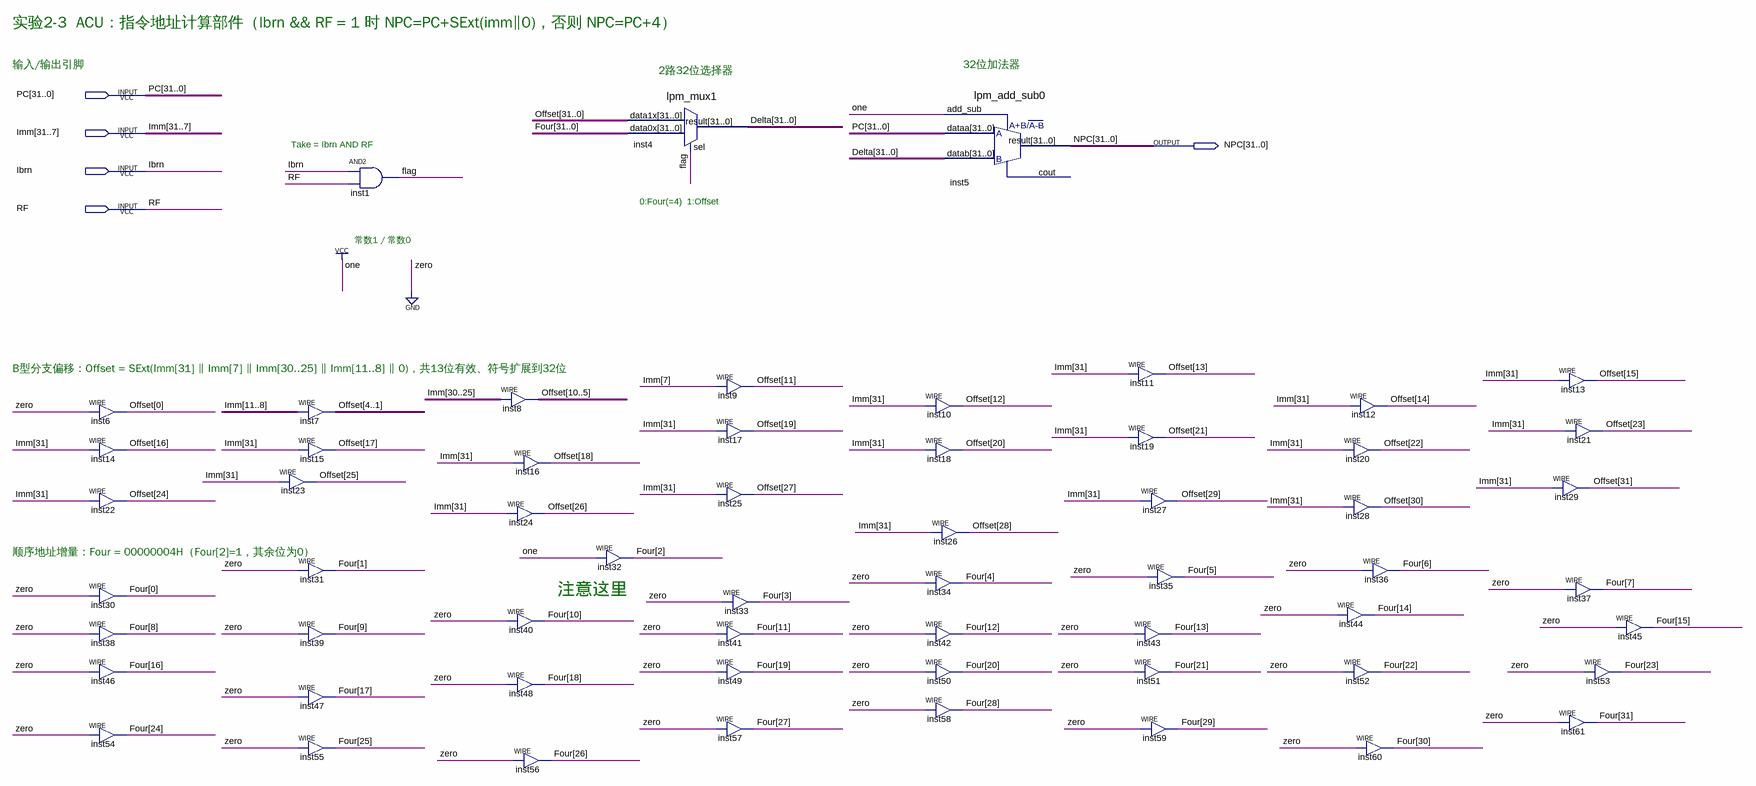
[diagram p0: schematic sheet]
// Quartus schematic ACU.bdf as structural Verilog: 59 symbols, 5 pins
module ACU (
  input  [31:0] PC,
  input  [31:7] Imm,
  input  Ibrn,
  input  RF,
  output [31:0] NPC
);

  wire flag;
  wire [31:0] Delta, Four, Offset;

  assign Offset[0] = 1'b0;  // WIRE inst6
  assign Offset[16] = Imm[31];  // WIRE inst14
  assign Offset[24] = Imm[31];  // WIRE inst22
  assign Four[0] = 1'b0;  // WIRE inst30
  assign Four[8] = 1'b0;  // WIRE inst38
  assign Four[16] = 1'b0;  // WIRE inst46
  assign Four[24] = 1'b0;  // WIRE inst54
  assign Offset[4:1] = Imm[11:8];  // WIRE inst7
  assign Offset[17] = Imm[31];  // WIRE inst15
  assign Offset[25] = Imm[31];  // WIRE inst23
  assign Four[1] = 1'b0;  // WIRE inst31
  assign Four[9] = 1'b0;  // WIRE inst39
  assign Four[17] = 1'b0;  // WIRE inst47
  assign Four[25] = 1'b0;  // WIRE inst55
  and inst1 (flag, Ibrn, RF);
  assign Offset[10:5] = Imm[30:25];  // WIRE inst8
  assign Offset[18] = Imm[31];  // WIRE inst16
  assign Offset[26] = Imm[31];  // WIRE inst24
  assign Four[10] = 1'b0;  // WIRE inst40
  assign Four[18] = 1'b0;  // WIRE inst48
  assign Four[26] = 1'b0;  // WIRE inst56
  assign Four[2] = 1'b1;  // WIRE inst32
  lpm_mux1 inst4 (.data1x(Offset), .data0x(Four), .sel(flag), .result(Delta));
  assign Offset[11] = Imm[7];  // WIRE inst9
  assign Offset[19] = Imm[31];  // WIRE inst17
  assign Offset[27] = Imm[31];  // WIRE inst25
  assign Four[11] = 1'b0;  // WIRE inst41
  assign Four[19] = 1'b0;  // WIRE inst49
  assign Four[27] = 1'b0;  // WIRE inst57
  assign Four[3] = 1'b0;  // WIRE inst33
  lpm_add_sub0 inst5 (.dataa(PC), .datab(Delta), .add_sub(1'b1), .result(NPC));  // open: cout
  assign Offset[12] = Imm[31];  // WIRE inst10
  assign Offset[20] = Imm[31];  // WIRE inst18
  assign Offset[28] = Imm[31];  // WIRE inst26
  assign Four[4] = 1'b0;  // WIRE inst34
  assign Four[12] = 1'b0;  // WIRE inst42
  assign Four[20] = 1'b0;  // WIRE inst50
  assign Four[28] = 1'b0;  // WIRE inst58
  assign Offset[13] = Imm[31];  // WIRE inst11
  assign Offset[21] = Imm[31];  // WIRE inst19
  assign Offset[29] = Imm[31];  // WIRE inst27
  assign Four[5] = 1'b0;  // WIRE inst35
  assign Four[13] = 1'b0;  // WIRE inst43
  assign Four[21] = 1'b0;  // WIRE inst51
  assign Four[29] = 1'b0;  // WIRE inst59
  assign Offset[14] = Imm[31];  // WIRE inst12
  assign Offset[22] = Imm[31];  // WIRE inst20
  assign Offset[30] = Imm[31];  // WIRE inst28
  assign Four[6] = 1'b0;  // WIRE inst36
  assign Four[14] = 1'b0;  // WIRE inst44
  assign Four[22] = 1'b0;  // WIRE inst52
  assign Four[30] = 1'b0;  // WIRE inst60
  assign Offset[15] = Imm[31];  // WIRE inst13
  assign Offset[23] = Imm[31];  // WIRE inst21
  assign Offset[31] = Imm[31];  // WIRE inst29
  assign Four[7] = 1'b0;  // WIRE inst37
  assign Four[31] = 1'b0;  // WIRE inst61
  assign Four[15] = 1'b0;  // WIRE inst45
  assign Four[23] = 1'b0;  // WIRE inst53

  // Notes on the sheet:
  //   实验2-3  ACU：指令地址计算部件（Ibrn && RF = 1 时 NPC=PC+SExt(imm‖0)，否则 NPC=PC+4）
  //   输入/输出引脚
  //   32位加法器
  //   2路32位选择器
  //   Take = Ibrn AND RF
  //   0:Four(=4)  1:Offset
  //   常数1 / 常数0
  //   B型分支偏移：Offset = SExt(Imm[31] ‖ Imm[7] ‖ Imm[30..25] ‖ Imm[11..8] ‖ 0)，共13位有效、符号扩展到32位
  //   顺序地址增量：Four = 00000004H（Four[2]=1，其余位为0）
  //   注意这里
endmodule
